# EasyEDA Pro project 水利智能船.epro, schematic Schematic1
Board Name: Board1; Create Date: 2025-05-19; Page Name: P1; Project Name: 水利智能船; Schematic Name: Schematic1; Update Date: 2025-05-28; Company: 嘉立创EDA; Page Size: A4; Version: V1.0
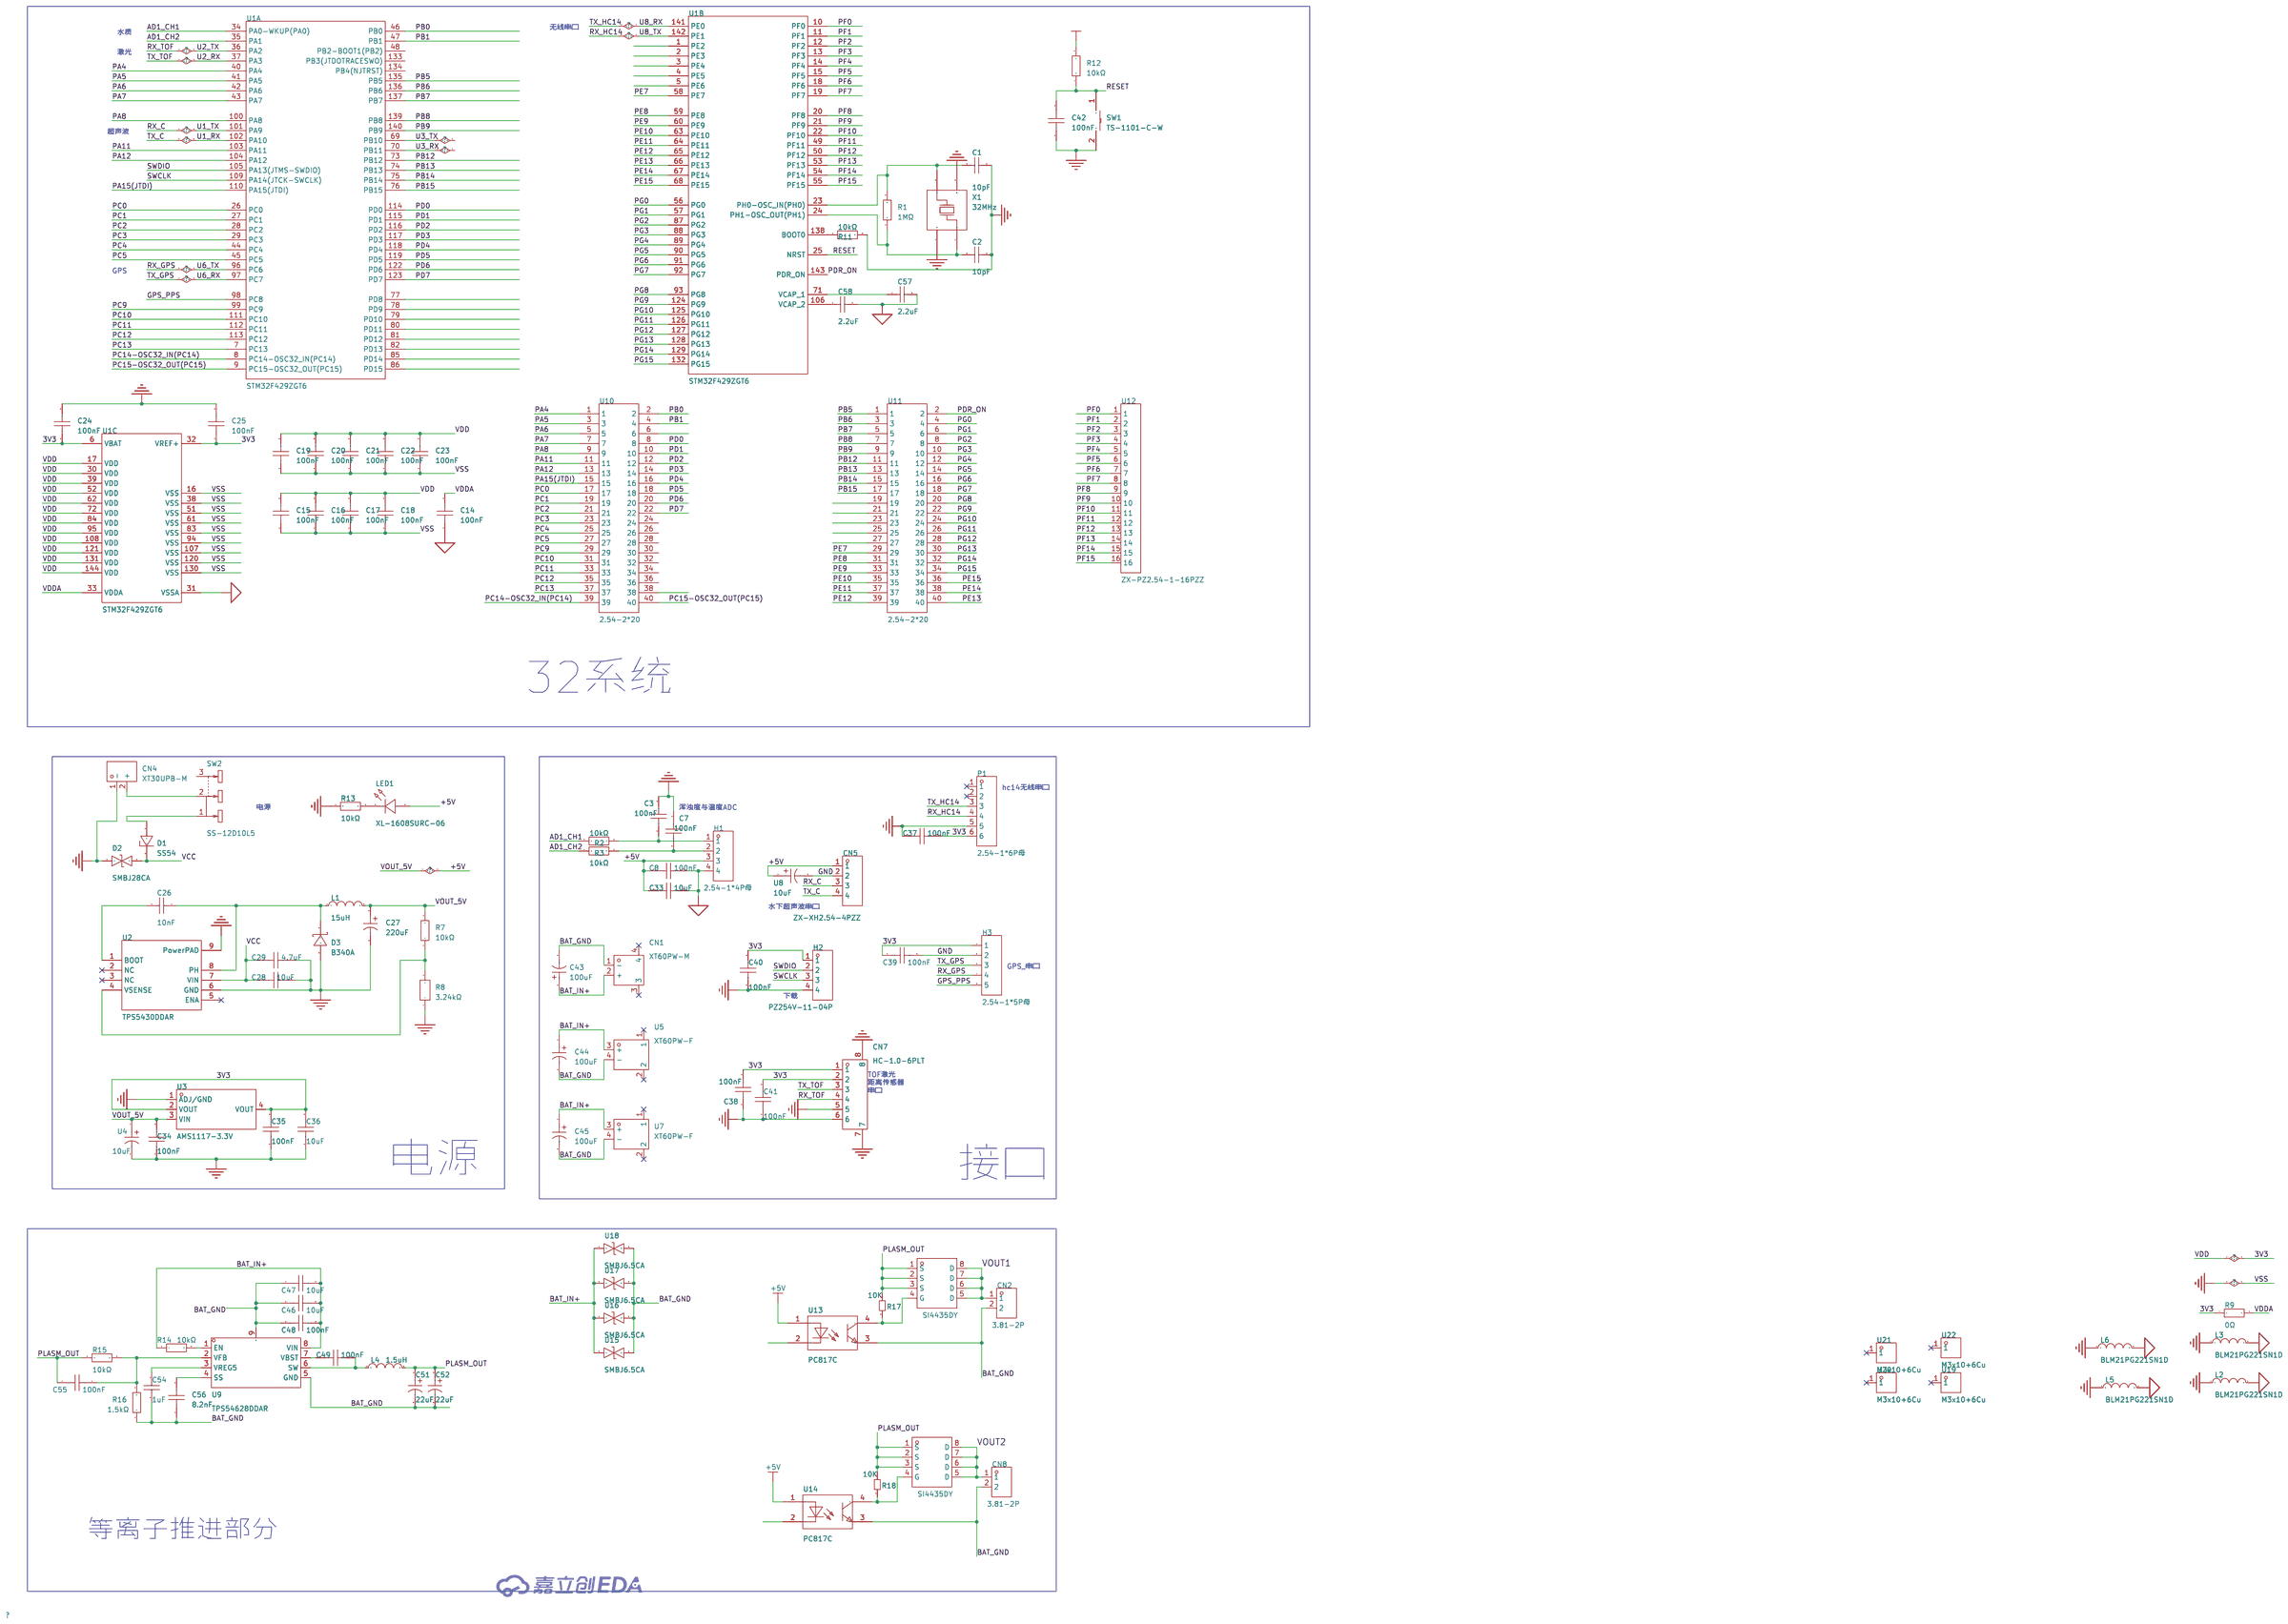
[diagram p0: schematic sheet]

## Parts
C1  10pF  [C0603]
C2  10pF  [C0603]
C3  100nF  [C0603]
C7  100nF  [C0603]
C8  100nF  [C0603]
C14  100nF  [C0603]
C15  100nF  [C0603]
C16  100nF  [C0603]
C17  100nF  [C0603]
C18  100nF  [C0603]
C19  100nF  [C0603]
C20  100nF  [C0603]
C21  100nF  [C0603]
C22  100nF  [C0603]
C23  100nF  [C0603]
C24  100nF  [C0603]
C25  100nF  [C0603]
C26  10nF  [C1206]
C27  220uF  [CAP-TH_BD6.3-P2.50-D0.6-FD-1]
C28  10uF  [C0805]
C29  4.7uF  [C0805]
C33  10uF  [C0603]
C34  100nF  [C0603]
C35  100nF  [C0603]
C36  10uF  [C0603]
C37  100nF  [C0603]
C38  100nF  [C0603]
C39  100nF  [C0603]
C40  100nF  [C0603]
C41  100nF  [C0603]
C42  100nF  [C0603]
C43  100uF  [CAP-TH_BD6.3-P2.50-D0.6-FD-1]
C44  100uF  [CAP-TH_BD6.3-P2.50-D0.6-FD-1]
C45  100uF  [CAP-TH_BD6.3-P2.50-D0.6-FD-1]
C46  10uF  [C1206]
C47  10uF  [C1206]
C48  100nF  [C0805]
C49  100nF  [C0805]
C51  22uF  [CAP-TH_BD6.3-P2.50-D0.6-FD-1]
C52  22uF  [CAP-TH_BD6.3-P2.50-D0.6-FD-1]
C54  1uF  [C0805]
C55  100nF  [C0805]
C56  8.2nF  [C0805]
C57  2.2uF  [C0603]
C58  2.2uF  [C0603]
CN1  XT60PW-M  [CONN-TH_XT60PW-M]
CN2  3.81-2P  [CONN-TH_2P-P3.81_KF2EDGR-3.81-2P]
CN4  XT30UPB-M  [CONN-TH_XT30UPB-M]
CN5  ZX-XH2.54-4PZZ  [CONN-TH_4P-P2.50_4PIN]
CN7  HC-1.0-6PLT  [CONN-SMD_6P-P1.00_HCTL_HC-1.0-6PLT]
CN8  3.81-2P  [CONN-TH_2P-P3.81_KF2EDGR-3.81-2P]
D1  SS54  [SMA_L4.3-W2.6-LS5.0-FD]
D2  SMBJ28CA  [SMB_L4.3-W3.6-LS5.4-BI]
D3  B340A  [SMA_L4.3-W2.6-LS5.1-RD]
H1  2.54-1*4P母  [HDR-TH_4P-P2.54-V-F]
H2  PZ254V-11-04P  [HDR-TH_4P-P2.54-V-M]
H3  2.54-1*5P母  [HDR-TH_5P-P2.54-V-F]
L1  15uH  [IND-SMD_L7.1-W6.6]
L2  BLM21PG221SN1D  [L0805]
L3  BLM21PG221SN1D  [L0805]
L4  1.5uH  [IND-SMD_L7.0-W6.6]
L5  BLM21PG221SN1D  [L0805]
L6  BLM21PG221SN1D  [L0805]
LED1  XL-1608SURC-06  [LED0603-RD_RED]
P1  2.54-1*6P母  [HDR-TH_6P-P2.54-V-F]
Q1  SI4435DY  [SOP-8_L5.0-W4.0-P1.27-LS6.0-BL]
Q2  SI4435DY  [SOP-8_L5.0-W4.0-P1.27-LS6.0-BL]
R1  1MΩ  [R0603]
R2  10kΩ  [R0603]
R3  10kΩ  [R0603]
R7  10kΩ  [R0805]
R8  3.24kΩ  [R0805]
R9  0Ω  [R0603]
R11  10kΩ  [R0603]
R12  10kΩ  [R0603]
R13  10kΩ  [R0603]
R14  10kΩ  [R0805]
R15  10kΩ  [R1206]
R16  1.5kΩ  [R1206]
R17  10K  [R0805]
R18  10K  [R0805]
SW1  TS-1101-C-W  [SW-SMD_L6.0-W3.3-LS8.0]
SW2  SS-12D10L5  [SW-TH_SS-12D10L5]
U1  STM32F429ZGT6  [LQFP-144_L20.0-W20.0-P0.50-LS22.0-BL]  (sections 1,2,3)
U2  TPS5430DDAR  [ESOP-8_L4.9-W3.9-P1.27-LS6.0-TL-EP]
U3  AMS1117-3.3V  [SOT-223-4_L6.5-W3.5-P2.30-LS7.0-TR]
U4  10uF  [CAP-SMD_L2.0-W1.3-FD]
U5  XT60PW-F  [TH_2P-XT60PW-F]
U7  XT60PW-F  [TH_2P-XT60PW-F]
U8  10uF  [CAP-SMD_L2.0-W1.3-FD]
U9  TPS54628DDAR  [ESOP-8_L4.9-W3.9-P1.27-LS6.0-BL-EP]
U10  2.54-2*20  [HDR-TH_40P-P2.54-V-F-R2-C20-S2.54]
U11  2.54-2*20  [HDR-TH_40P-P2.54-V-F-R2-C20-S2.54]
U12  ZX-PZ2.54-1-16PZZ  [HDR-TH_16P-P2.54-V-M-2]
U13  PC817C  [OPTO-SMD-4_L4.6-W6.5-P2.54-LS10.3-TL]
U14  PC817C  [OPTO-SMD-4_L4.6-W6.5-P2.54-LS10.3-TL]
U15  SMBJ6.5CA  [SMB_L4.6-W3.5-LS5.3-BI]
U16  SMBJ6.5CA  [SMB_L4.6-W3.5-LS5.3-BI]
U17  SMBJ6.5CA  [SMB_L4.6-W3.5-LS5.3-BI]
U18  SMBJ6.5CA  [SMB_L4.6-W3.5-LS5.3-BI]
U19  M3x10+6Cu  [SMD_L4.7-W4.7-D3.0]
U20  M3x10+6Cu  [SMD_L4.7-W4.7-D3.0]
U21  M3x10+6Cu  [SMD_L4.7-W4.7-D3.0]
U22  M3x10+6Cu  [SMD_L4.7-W4.7-D3.0]
X1  32MHz  [CRYSTAL-SMD_4P-L3.2-W2.5-BL]

## Library data of the parts
C1 C2 = CL10C100JB8NNNC: 容值:10pF;精度:±5%;额定电压:50V;材质(温度系数):C0G;; LCSC Part Name: 10pF ±5% 50V; Supplier Part: C1634; Manufacturer: SAMSUNG(三星); Supplier Footprint: 0603; JLCPCB Part Class: 基础库; Datasheet: https://atta.szlcsc.com/upload/public/pdf/source/20160218/1457707763339.pdf; Supplier: LCSC; Tolerance: ±5%; Voltage Rated: 50V; Temperature Coefficient: C0G
C3 C7 C8 C14-C25 C34 C35 C37-C42 = CGA0603X7R104K500JT: 容值:100nF;精度:±10%;额定电压:50V;温度系数:X7R;; LCSC Part Name: 100nF ±10% 50V; Supplier Part: C6119867; Manufacturer: HRE(芯声); Supplier Footprint: 0603; JLCPCB Part Class: 扩展库; Datasheet: https://atta.szlcsc.com/upload/public/pdf/source/20250103/C44077DA9E7B3EFAE02F22B6D3D1CBC9.pdf; Supplier: LCSC; Tolerance: ±10%; Voltage Rating: 50V; Temperature Coefficient: X7R
C26 = 1206B103K102NT: 容值:10nF;精度:±10%;额定电压:1kV;温度系数:X7R;; LCSC Part Name: 10nF ±10% 1kV; Supplier Part: C9194; Manufacturer: FH(风华); Supplier Footprint: 1206; JLCPCB Part Class: 扩展库; Datasheet: https://atta.szlcsc.com/upload/public/pdf/source/20200305/C486355_26A10D38EF8C2A5C37091D0039909270.pdf; Supplier: LCSC; Tolerance: ±10%; Voltage Rating: 1kV; Temperature Coefficient: X7R
C27 = PA35V220M6x12: 容值:220uF;精度:±20%;额定电压:35V;纹波电流:3.98A@100Hz;等效串联电阻(ESR):16mΩ@100kHz;类型:-;; LCSC Part Name: 220uF ±20% 35V; Supplier Part: C46550432; Manufacturer: 捷而瑞; Supplier Footprint: 插件,D6.3xL12mm; JLCPCB Part Class: 扩展库; Datasheet: https://atta.szlcsc.com/upload/public/pdf/source/20250307/831193F737CAF6D75AC25F14E955F0EC.pdf; Supplier: LCSC; Tolerance: ±20%; Voltage Rating: 35V; Ripple Current: 3.98A@100Hz; Equivalent Series Resistance(ESR): 16mΩ@100kHz; Diameter: 6.3mm; Height - Seated (Max): 12mm; Lifetime: 2000hrs@105℃; Operating Temperature: -55℃~+105℃
C28 = CGA0805X5R106K250MT: 容值:10uF;精度:±10%;额定电压:25V;温度系数:X5R;; LCSC Part Name: 10uF ±10% 25V; Supplier Part: C6119887; Manufacturer: HRE(芯声); Supplier Footprint: 0805; JLCPCB Part Class: 扩展库; Supplier: LCSC; Tolerance: ±10%; Voltage Rating: 25V; Temperature Coefficient: X5R
C29 = CGA0805X7R475K350MT: 容值:4.7uF;精度:±10%;额定电压:35V;材质(温度系数):X7R;; LCSC Part Name: 4.7uF ±10% 35V; Supplier Part: C6119943; Manufacturer: HRE(芯声); Supplier Footprint: 0805; JLCPCB Part Class: 扩展库; Supplier: LCSC; Tolerance: ±10%; Voltage Rated: 35V; Temperature Coefficient: X7R
C33 C36 = CGA0603X5R106K100JT: 容值:10uF;精度:±10%;额定电压:10V;温度系数:X5R;; LCSC Part Name: 10uF ±10% 10V; Supplier Part: C6119842; Manufacturer: HRE(芯声); Supplier Footprint: 0603; JLCPCB Part Class: 扩展库; Supplier: LCSC; Tolerance: ±10%; Voltage Rating: 10V; Temperature Coefficient: X5R
C43-C45 = PA50V100M6x12: 容值:100uF;精度:±20%;额定电压:50V;纹波电流:2.98A@100Hz;等效串联电阻(ESR):25mΩ@100kHz;类型:-;; LCSC Part Name: 100uF ±20% 50V; Supplier Part: C46550456; Manufacturer: 捷而瑞; Supplier Footprint: 插件,D6.3xL12mm; JLCPCB Part Class: 扩展库; Datasheet: https://atta.szlcsc.com/upload/public/pdf/source/20250307/831193F737CAF6D75AC25F14E955F0EC.pdf; Supplier: LCSC; Tolerance: ±20%; Voltage Rating: 50V; Ripple Current: 2.98A@100Hz; Equivalent Series Resistance(ESR): 25mΩ@100kHz; Diameter: 6.3mm; Height - Seated (Max): 12mm; Lifetime: 2000hrs@105℃; Operating Temperature: -55℃~+105℃
C46 C47 = HGC1206R5106K500NSPJ: 容值:10uF;精度:±10%;额定电压:50V;温度系数:X5R;; LCSC Part Name: 10uF ±10% 50V; Supplier Part: C7432781; Manufacturer: Chinocera(华瓷); Supplier Footprint: 1206; JLCPCB Part Class: 扩展库; Datasheet: https://atta.szlcsc.com/upload/public/pdf/source/20240320/FAC3FEC40A78BC5CCCE96C232A94D860.pdf; Supplier: LCSC; Tolerance: ±10%; Voltage Rating: 50V; Temperature Coefficient: X5R
C48 C49 C55 = CC0805KRX7R9BB104: 容值:100nF;精度:±10%;额定电压:50V;材质(温度系数):X7R;; LCSC Part Name: 100nF ±10% 50V; Supplier Part: C49678; Manufacturer: YAGEO(国巨); Supplier Footprint: 0805; JLCPCB Part Class: 基础库; Datasheet: https://atta.szlcsc.com/upload/public/pdf/source/20180224/C181747_15194369449651363981.pdf; Supplier: LCSC; Tolerance: ±10%; Voltage Rated: 50V; Temperature Coefficient: X7R
C51 C52 = PA50V22M6x7: 容值:22uF;精度:±20%;额定电压:50V;纹波电流:2.6A@100Hz;等效串联电阻(ESR):40mΩ@100kHz;类型:-;; LCSC Part Name: 22uF ±20% 50V; Supplier Part: C46550455; Manufacturer: 捷而瑞; Supplier Footprint: 插件,D6.3xL7mm; JLCPCB Part Class: 扩展库; Datasheet: https://atta.szlcsc.com/upload/public/pdf/source/20250307/831193F737CAF6D75AC25F14E955F0EC.pdf; Supplier: LCSC; Tolerance: ±20%; Voltage Rating: 50V; Ripple Current: 2.6A@100Hz; Equivalent Series Resistance(ESR): 40mΩ@100kHz; Diameter: 6.3mm; Height - Seated (Max): 7mm; Lifetime: 2000hrs@105℃; Operating Temperature: -55℃~+105℃
C54 = CL21B105KBFNNNE: 容值:1uF;精度:±10%;额定电压:50V;材质(温度系数):X7R;; LCSC Part Name: 1uF ±10% 50V; Supplier Part: C28323; Manufacturer: SAMSUNG(三星); Supplier Footprint: 0805; JLCPCB Part Class: 基础库; Datasheet: https://atta.szlcsc.com/upload/public/pdf/source/20160218/1457707763339.pdf; Supplier: LCSC; Tolerance: ±10%; Voltage Rated: 50V; Temperature Coefficient: X7R
C56 = HGC0805R7822K500NTHJ: 容值:8.2nF;精度:±10%;额定电压:50V;温度系数:X7R;; LCSC Part Name: 8.2nF ±10% 50V; Supplier Part: C5186817; Manufacturer: Chinocera(华瓷); Supplier Footprint: 0805; JLCPCB Part Class: 扩展库; Datasheet: https://atta.szlcsc.com/upload/public/pdf/source/20240320/FAC3FEC40A78BC5CCCE96C232A94D860.pdf; Supplier: LCSC; Tolerance: ±10%; Voltage Rating: 50V; Temperature Coefficient: X7R
C57 C58 = CL10A225KO8NNNC: 容值:2.2uF;精度:±10%;额定电压:16V;材质(温度系数):X5R;; LCSC Part Name: 2.2uF ±10% 16V; Supplier Part: C23630; Manufacturer: SAMSUNG(三星); Supplier Footprint: 0603; JLCPCB Part Class: 基础库; Datasheet: https://atta.szlcsc.com/upload/public/pdf/source/20160218/1457707763339.pdf; Supplier: LCSC; Tolerance: ±10%; Voltage Rated: 16V; Temperature Coefficient: X5R
CN1 = XT60PW-M: 类别:-;类型1:-;; LCSC Part Name: AMASS(艾迈斯)航模插头xt60连接器150公母对接pw锂电池公头 板插卧式XT60PW-M; Supplier Part: C98732; Manufacturer: AMASS(艾迈斯); JLCPCB Part Class: 扩展库; Datasheet: https://atta.szlcsc.com/upload/public/pdf/source/20240118/44A3DCFF53BE25DC65378AFFB21277A4.pdf; Supplier: LCSC; Brand: 艾迈斯; Type: 卧式插头; Colour: 黄色; InterfaceType: 公头
CN2 CN8 = KF2EDGR-3.81-2P: 连接器类型:板端/插座-闭口;结构:1x2P;间距:3.81mm;颜色:绿色;安装方式:弯针;排数:1;每排PIN数:2;额定电流:8A;额定电压:300V;工作温度范围:-40℃~+105℃;; LCSC Part Name: 3.81mm 1x2P 排数:1 每排P数:2; Supplier Part: C441182; Manufacturer: KEFA(科发); Supplier Footprint: 弯插,P=3.81mm; JLCPCB Part Class: 扩展库; Datasheet: https://atta.szlcsc.com/upload/public/pdf/source/20230331/6258E6C6BF04EFF922F3E5A9E72A4547.pdf; Supplier: LCSC; Connector Type: 板端/插座-闭口; Structure: 1x2P; Pitch: 3.81mm; Color: 绿色; Mounting Style: 弯针; Number of Pins: 2P; Number of Rows: 1; Number of PINs Per Row: 2; Current Rating (Max): 8A; Voltage Rating (Max): 300V; Operating Temperature Range: -40℃~+105℃
CN4 = XT30UPB-M: 类别:-;类型1:-;; LCSC Part Name: AMASS(艾迈斯)板载立式 航模锂电池控制器连接器插头 公头XT30UPB-M; Supplier Part: C428721; Manufacturer: AMASS(艾迈斯); JLCPCB Part Class: 扩展库; Datasheet: https://atta.szlcsc.com/upload/public/pdf/source/20230412/7B5DFEF57C9EA5273853390C734B3AC5.pdf; Supplier: LCSC; Brand: 艾迈斯; Type: 航模插头; Colour: 黄色; RatedVoltage: DC 500V; InterfaceType: 公头; MetalMaterial: 镀金; InsulationMaterial: PA; RatedCurrent: 15A; contact resistance: 0.65mΩ
CN5 = ZX-XH2.54-4PZZ: 插针结构:1x4P;间距:2.5mm;安装方式:直插;参考系列:XH;总PIN数:4P;排数:1;每排PIN数:4;行距:-;额定电流:3A;触头材质:黄铜;触头镀层:锡;工作温度范围:-25℃~+85℃;; LCSC Part Name: 1x4P 间距:2.5mm 直插 系列:XH; Supplier Part: C7429634; Manufacturer: Megastar(兆星); Supplier Footprint: 插件,P=2.5mm; JLCPCB Part Class: 扩展库; Datasheet: https://atta.szlcsc.com/upload/public/pdf/source/20230619/B529A2163E0159A644AB3383D208FB03.pdf; Supplier: LCSC; Pins Structure: 1x4P; Pitch: 2.5mm; Mounting Type: 直插; Reference Series: XH; Number of Pins: 4P; Number of Rows: 1; Number of PINs Per Row: 4; Rated Current: 3A; Contact Material: 黄铜; Contact Plating: 锡; Operating Temperature: -25℃~+85℃; Rated Voltage (Max): 250V; Plastic Material: PA66; Flame Retardant Rating: UL94V-0; Color: 白色; Z-Height of the Board: 7mm; X-Length of Bottom Edge on Board (Spacing Line): 12.5mm; Y-Width of Bottom Edge on Board: 5.9mm
CN7 = HC-1.0-6PLT: 插针结构:1x6P;间距:1mm;安装方式:立贴;参考系列:SH;总PIN数:6P;排数:1;每排PIN数:6;行距:-;额定电流:1A;触头材质:磷青铜;触头镀层:锡;工作温度范围:-25℃~+85℃;; LCSC Part Name: 1x6P 间距:1mm 立贴 系列:SH; Supplier Part: C2845374; Manufacturer: HCTL(华灿天禄); Supplier Footprint: SMD,P=1mm; JLCPCB Part Class: 扩展库; Datasheet: https://atta.szlcsc.com/upload/public/pdf/source/20230707/856B0E69F1F787EF574200B3D73A313F.pdf; Supplier: LCSC; Pins Structure: 1x6P; Pitch: 1mm; Mounting Style: 立贴; Reference Series: SH; Number of Pins: 6P; Number of Rows: 1; Number of PINs Per Row: 6; Current Rating (Max): 1A; Contact Material: 磷青铜; Contact Plating: 锡; Operating Temperature Range: -25℃~+85℃; Rated Voltage (Max): 50V; Plastic Material: LCP; Flame Retardant Rating: UL94V-0; Supplementary Features: 辅助焊脚; Z-Height of the Board: 4.4mm; X-Length of Bottom Edge on Board (Spacing Line): 8.3mm; Y-Width of Bottom Edge on Board: 3.76mm
D1 = SS54_C7420369: 二极管配置:独立式;正向压降(Vf):550mV@5.0A;直流反向耐压(Vr):40V;整流电流:5A;; LCSC Part Name: 电压:40V 电流:5A; Supplier Part: C7420369; Manufacturer: 宏迦橙; Supplier Footprint: SMA(DO-214AC); JLCPCB Part Class: 扩展库; Datasheet: https://atta.szlcsc.com/upload/public/pdf/source/20230828/254C3882F8647358AD9F60DD73611B5E.pdf; Supplier: LCSC; Diode Configuration: 独立式; Forward Voltage (Vf@If): 550mV@5.0A; Reverse Voltage (Vr): 40V; Rectified Current: 5A; Reverse Leakage Current (Ir): 50uA@40V
D2 = SMBJ28CA_C151259: 反向截止电压(Vrwm):28V;最大钳位电压:45.4V;峰值脉冲电流(Ipp)@10/1000us:13.3A;峰值脉冲功率(Ppp)@10/1000us:600W;击穿电压:31.1V;; Supplier Part: C151259; Manufacturer: Littelfuse(美国力特); Supplier Footprint: SMB(DO-214AA); JLCPCB Part Class: 扩展库; Datasheet: https://atta.szlcsc.com/upload/public/pdf/source/20190807/C409416_D98C874D944FBE9BE31A2BD6B7A21533.pdf; Supplier: LCSC; Reverse Stand-Off Voltage (Vrwm): 28V; Maximum Clamping Voltage: 45.4V; Peak Pulse Current (Ipp)@10/1000us: 13.3A; Peak Pulse Power Dissipation (Ppp)@10/1000us: 600W; Breakdown Voltage: 31.1V; Type: TVS
D3 = B340A: 二极管配置:独立式;正向压降(Vf):550mV@3A;直流反向耐压(Vr):40V;整流电流:3A;; LCSC Part Name: 电压:40V 电流:3A; Supplier Part: C64982; Manufacturer: MDD(辰达半导体); Supplier Footprint: SMA(DO-214AC); JLCPCB Part Class: 扩展库; Datasheet: https://atta.szlcsc.com/upload/public/pdf/source/20240710/591710C3B34CDB7FE3DA92C119E6F598.pdf; Supplier: LCSC; Diode Configuration: 独立式; Forward Voltage (Vf@If): 550mV@3A; Reverse Voltage (Vr): 40V; Rectified Current: 3A; Reverse Leakage Current (Ir): 500uA@40V
H1 = 2.54-1*4P母: 插孔结构:1x4P;间距:2.54mm;行距:-;圆孔/方孔:方孔;安装类型:直插;排数:单排;总孔位数:4P;额定电流:3A;额定电压:-;插孔方向:顶部;塑高:-;触头材质:青铜;触头镀层:-;工作温度范围:-40℃~+105℃;焊接温度(最大值):-;; LCSC Part Name: 间距:2.54mm 1x4P 直插; Supplier Part: C2718488; Manufacturer: BOOMELE(博穆精密); Supplier Footprint: 插件,P=2.54mm; JLCPCB Part Class: 扩展库; Datasheet: https://atta.szlcsc.com/upload/public/pdf/source/20210301/C2718488_F4427B881E42CAA8DDB0B1C12B3A522C.pdf; Supplier: LCSC; Holes Structure: 1x4P; Pitch: 2.54mm; Circular Hole / Square Hole: 方孔; Mounting Type: 直插; Number of Rows: 单排; Number of Holes: 4P; Current Rating (Max): 3A; Holes Direction: 顶部; Contact Material: 青铜; Operating Temperature Range: -40℃~+105℃
H2 = PZ254V-11-04P: 插针结构:1x4P;间距:2.54mm;行距:-;圆针/方针:方针;安装类型:直插;排数:单排;总PIN位数:4P;额定电流:3A;额定电压:250V;配合针长度:6mm;塑高:2.5mm;端接针长度:3mm;触头材质:-;工作温度范围:-40℃~+105℃;颜色:黑色;; LCSC Part Name: 间距:2.54mm 1x4P 直插 方针; Supplier Part: C2691448; Manufacturer: XFCN(兴飞); Supplier Footprint: 插件,P=2.54mm; JLCPCB Part Class: 扩展库; Datasheet: https://atta.szlcsc.com/upload/public/pdf/source/20200309/C492403_F9F19131791D08044AD4F84F8E751A34.pdf; Supplier: LCSC; Pin Structure: 1x4P; Pitch: 2.54mm; Circluar Pins/Square Pins: 方针; Mounting Type: 直插; Number of Rows: 单排; Number of Pins: 4P; Current Rating (Max): 3A; Voltage Rating (Max): 250V; Length of Mating Pin: 6mm; Insulation Height: 2.5mm; Length of End Connection Pin: 3mm; Operating Temperature Range: -40℃~+105℃; Color: 黑色
H3 = 2.54-1*5P母: 插孔结构:1x5P;间距:2.54mm;行距:-;安装类型:直插;排数:单排;总孔位数:5P;塑高:-;触头材质:-;触头镀层:-;; LCSC Part Name: 间距:2.54mm 1x5P 直插; Supplier Part: C50950; Manufacturer: BOOMELE(博穆精密); Supplier Footprint: 插件,P=2.54mm; JLCPCB Part Class: 扩展库; Datasheet: https://atta.szlcsc.com/upload/public/pdf/source/20210301/C2718488_F4427B881E42CAA8DDB0B1C12B3A522C.pdf; Supplier: LCSC; Holes Structure: 1x5P; Pitch: 2.54mm; Mounting Type: 直插; Number of Rows: 单排; Number of Holes: 5P
L1 = SMMS0650-150M: 电感值:15uH;精度:±20%;额定电流:3.1A;饱和电流(Isat):5A;类型:一体成型电感;; LCSC Part Name: 15uH ±20% 5A; Supplier Part: C149585; Manufacturer: SXN(顺翔诺); Supplier Footprint: SMD,6.6x7.1mm; JLCPCB Part Class: 扩展库; Datasheet: https://atta.szlcsc.com/upload/public/pdf/source/20210810/BBF24330FB2F5029F637830BA9C42C0D.pdf; Supplier: LCSC; Tolerance: ±20%; Rated Current: 3.1A; Saturation Current (Isat): 5A; DC Resistance (DCR): 85mΩ; Type: 一体成型电感
L2 L3 L5 L6 = BLM21PG221SN1D: 标称阻抗@测试频率:220Ω@100MHz;误差:±25%;直流电阻(RDC):45mΩ;; LCSC Part Name: 单路 0805磁珠 阻抗220Ω@100MHz; Supplier Part: C85840; Manufacturer: muRata(村田); Supplier Footprint: 0805; JLCPCB Part Class: 扩展库; Datasheet: https://atta.szlcsc.com/upload/public/pdf/source/20180326/C118443_3FAC30E9A4F0E6B81275543C61E0685E.pdf; Supplier: LCSC; Impedance @ Frequency: 220Ω@100MHz; Tolerance: ±25%; DC Resistance: 45mΩ; Current Rating: 2A; Circuits: 1
L4 = FXL0630-1R5-M: 电感值:1.5uH;精度:±20%;额定电流:12A;饱和电流(Isat):14A;类型:一体成型电感;; LCSC Part Name: 1.5uH ±20% 14A; Supplier Part: C167217; Manufacturer: cjiang(长江微电); Supplier Footprint: SMD,6.6x7mm; JLCPCB Part Class: 扩展库; Datasheet: https://atta.szlcsc.com/upload/public/pdf/source/20240426/3189EA8206330E2108542F9E34E540E7.pdf; Supplier: LCSC; Tolerance: ±20%; Rated Current: 12A; Saturation Current (Isat): 14A; DC Resistance (DCR): 12.1mΩ; Type: 一体成型电感
LED1 = XL-1608SURC-06: 灯头类型:-;发光颜色:红色;正向压降(Vf):2.3V;功率:50mW;正向电流:20mA;波长:620nm~630nm;二极管配置:-;透镜颜色:无色透明透镜;色温:-;发光强度:225mcd;发光角度:120°;载带方式:正贴;工作温度:-20℃~+85℃;; Supplier Part: C965799; Manufacturer: XINGLIGHT(成兴光); Supplier Footprint: 0603; JLCPCB Part Class: 扩展库; Datasheet: https://atta.szlcsc.com/upload/public/pdf/source/20250213/F9766CE804AF391355DCDD48DB3E0DAB.pdf; Supplier: LCSC; Illumination Color: 红色; Voltage - Forward(Vf): 2.3V; Power(Watts): 50mW; Forward Current: 20mA; Wavelength - Dominant: 620nm~630nm; Peak Wavelength: 625nm; Lens Color: 无色透明透镜; Luminous Intensity: 225mcd; Viewing Angle: 120°; Mounting Sytle: 正贴; Operating Temperature: -20℃~+85℃
P1 = 2.54-1*6P母: 插孔结构:1x6P;间距:2.54mm;行距:-;安装类型:直插;排数:单排;总孔位数:6P;塑高:-;触头材质:-;触头镀层:-;; LCSC Part Name: 间距:2.54mm 1x6P 直插; Supplier Part: C40877; Manufacturer: BOOMELE(博穆精密); Supplier Footprint: 插件,P=2.54mm; JLCPCB Part Class: 扩展库; Datasheet: https://atta.szlcsc.com/upload/public/pdf/source/20210301/C2718488_F4427B881E42CAA8DDB0B1C12B3A522C.pdf; Supplier: LCSC; Holes Structure: 1x6P; Pitch: 2.54mm; Mounting Type: 直插; Number of Rows: 单排; Number of Holes: 6P
Q1 Q2 = SI4435DY_C382326: 类型:P沟道;漏源电压(Vdss):30V;连续漏极电流(Id):8.8A;功率(Pd):2.5W;导通电阻(RDS(on)@Vgs,Id):20mΩ@10V,8A;阈值电压(Vgs(th)@Id):3V@250uA;; LCSC Part Name: P沟道 30V 8.8A; Supplier Part: C382326; Manufacturer: KEXIN(科信); Supplier Footprint: SOP-8; JLCPCB Part Class: Extended Part; Datasheet: https://atta.szlcsc.com/upload/public/pdf/source/20190705/C382326_F36EB2E223B1066BA249D2C6D7A5BA1D.pdf; Supplier: LCSC; Type: P沟道; Drain Source Voltage (Vdss): 30V; Continuous Drain Current (Id): 8.8A; Power Dissipation (Pd): 2.5W; Drain Source On Resistance (RDS(on)@Vgs,Id): 20mΩ@10V,8A; Gate Threshold Voltage (Vgs(th)@Id): 3V@250uA
R1 = 0603WAF1004T5E: 电阻类型:厚膜电阻;阻值:1MΩ;精度:±1%;功率:100mW;最大工作电压:75V;温度系数:±100ppm/℃;; LCSC Part Name: 1MΩ ±1% 100mW 厚膜电阻; Supplier Part: C22935; Manufacturer: UNI-ROYAL(厚声); Supplier Footprint: 0603; JLCPCB Part Class: 基础库; Datasheet: https://atta.szlcsc.com/upload/public/pdf/source/20200306/C422600_1E6D84923E4A46A82E41ADD87F860B5C.pdf; Supplier: LCSC; Type: 厚膜电阻; Tolerance: ±1%; Power(Watts): 100mW; Overload Voltage (Max): 75V; Temperature Coefficient: ±100ppm/℃; Operating Temperature Range: -55℃~+155℃
R2 R3 R11-R13 = 0603WAF1002T5E: 电阻类型:厚膜电阻;阻值:10kΩ;精度:±1%;功率:100mW;最大工作电压:75V;温度系数:±100ppm/℃;; LCSC Part Name: 厚膜电阻 10kΩ ±1% 100mW; Supplier Part: C25804; Manufacturer: UNI-ROYAL(厚声); Supplier Footprint: 0603; JLCPCB Part Class: 基础库; Datasheet: https://atta.szlcsc.com/upload/public/pdf/source/20200306/C422600_1E6D84923E4A46A82E41ADD87F860B5C.pdf; Supplier: LCSC; Type: 厚膜电阻; Tolerance: ±1%; Power(Watts): 100mW; Overload Voltage (Max): 75V; Temperature Coefficient: ±100ppm/℃; Operating Temperature Range: -55℃~+155℃
R7 R14 = 0805W8F1002T5E_C17414: 电阻类型:厚膜电阻;阻值:10kΩ;精度:±1%;功率:125mW;最大工作电压:150V;温度系数:±100ppm/℃;; LCSC Part Name: 10kΩ ±1% 125mW 厚膜电阻; Supplier Part: C17414; Manufacturer: UNI-ROYAL(厚声); Manufacturer Part: 0805W8F1002T5E; Supplier Footprint: 0805; JLCPCB Part Class: 基础库; Datasheet: https://atta.szlcsc.com/upload/public/pdf/source/20200306/C422600_1E6D84923E4A46A82E41ADD87F860B5C.pdf; Supplier: LCSC; Type: 厚膜电阻; Tolerance: ±1%; Power(Watts): 125mW; Overload Voltage (Max): 150V; Temperature Coefficient: ±100ppm/℃; Operating Temperature Range: -55℃~+155℃
R8 = FRC0805F3241TS: 电阻类型:厚膜电阻;阻值:3.24kΩ;精度:±1%;功率:125mW;最大工作电压:150V;温度系数:±100ppm/℃;; LCSC Part Name: 3.24kΩ ±1% 125mW 厚膜电阻; Supplier Part: C2933414; Manufacturer: FOJAN(富捷); Supplier Footprint: 0805; JLCPCB Part Class: 扩展库; Datasheet: https://atta.szlcsc.com/upload/public/pdf/source/20211221/925EC7D7225764EE0046F22065062C87.pdf; Supplier: LCSC; Type: 厚膜电阻; Tolerance: ±1%; Power(Watts): 125mW; Overload Voltage (Max): 150V; Temperature Coefficient: ±100ppm/℃; Operating Temperature Range: -55℃~+155℃
R9 = 0603WAF0000T5E: 电阻类型:厚膜电阻;阻值:0Ω;精度:±1%;功率:100mW;最大工作电压:75V;; LCSC Part Name: 0Ω ±1% 100mW 厚膜电阻; Supplier Part: C21189; Manufacturer: UNI-ROYAL(厚声); Supplier Footprint: 0603; JLCPCB Part Class: 基础库; Datasheet: https://atta.szlcsc.com/upload/public/pdf/source/20200306/C422600_1E6D84923E4A46A82E41ADD87F860B5C.pdf; Supplier: LCSC; Type: 厚膜电阻; Tolerance: ±1%; Power(Watts): 100mW; Overload Voltage (Max): 75V; Operating Temperature Range: -55℃~+155℃
R15 = 1206W4F1002T5E: 电阻类型:厚膜电阻;阻值:10kΩ;精度:±1%;功率:250mW;最大工作电压:200V;温度系数:±100ppm/℃;; LCSC Part Name: 10kΩ ±1% 250mW 厚膜电阻; Supplier Part: C17902; Manufacturer: UNI-ROYAL(厚声); Supplier Footprint: 1206; JLCPCB Part Class: 基础库; Datasheet: https://atta.szlcsc.com/upload/public/pdf/source/20200306/C422600_1E6D84923E4A46A82E41ADD87F860B5C.pdf; Supplier: LCSC; Type: 厚膜电阻; Tolerance: ±1%; Power(Watts): 250mW; Overload Voltage (Max): 200V; Temperature Coefficient: ±100ppm/℃; Operating Temperature Range: -55℃~+155℃
R16 = 1206W4F1501T5E: 电阻类型:厚膜电阻;阻值:1.5kΩ;精度:±1%;功率:250mW;最大工作电压:200V;温度系数:±100ppm/℃;; LCSC Part Name: 1.5kΩ ±1% 250mW 厚膜电阻; Supplier Part: C26030; Manufacturer: UNI-ROYAL(厚声); Supplier Footprint: 1206; JLCPCB Part Class: 扩展库; Datasheet: https://atta.szlcsc.com/upload/public/pdf/source/20200306/C422600_1E6D84923E4A46A82E41ADD87F860B5C.pdf; Supplier: LCSC; Type: 厚膜电阻; Tolerance: ±1%; Power(Watts): 250mW; Overload Voltage (Max): 200V; Temperature Coefficient: ±100ppm/℃; Operating Temperature Range: -55℃~+155℃
R17 R18 = 10K: Design Item ID: 电阻; Library Name: 新 Sch
SW1 = TS-1101-C-W: 电路结构:单刀单掷;按钮形状:矩形按钮;作用力:260gf;安装方式:立贴;开关长度:6mm;开关宽度:3.6mm;开关高度:2.5mm;带支架:不带;触点电流:50mA;额定电压(AC):-;额定电压(DC):12V;额定功率:-;绝缘电阻:-;带灯:无;机械寿命:5万次;; LCSC Part Name: 6*3.6*2.5mm 立贴 轻触开关; Supplier Part: C318938; Manufacturer: XKB Connectivity(中国星坤); Supplier Footprint: SMD; JLCPCB Part Class: 扩展库; Datasheet: https://atta.szlcsc.com/upload/public/pdf/source/20200227/C318938_C2E53B1EEDE37D980A33616AC086DE53.pdf; Supplier: LCSC; Circuit: 单刀单掷; Actuator Style: 矩形按钮; Operating Force: 260gf; Mounting Style: 立贴; Switch Length: 6mm; Switch Width: 3.6mm; Switch Height: 2.5mm; Strike Gundam: 不带; Contact Current: 50mA; Voltage Rating (DC): 12V; Actuator/Cap Color: 白色带淡绿; With Lamp: 无; Mechanical Life: 5万次; Operating Temperature: -30℃~+85℃
SW2 = SS-12D10L5: 电路结构:单刀双掷;安装方式:直插;开关颜色:黑色;额定电流(DC):3A;额定电压(DC):125V;额定电流(AC):3A;额定电压(AC):125V;机械寿命:1万次;; LCSC Part Name: 柄长5mm 直插双档 滑动开关; Supplier Part: C319012; Manufacturer: XKB Connectivity(中国星坤); Supplier Footprint: 插件; JLCPCB Part Class: 扩展库; Datasheet: https://atta.szlcsc.com/upload/public/pdf/source/20211009/D6412F37AABE6F9459A6EE7FA4DAEADB.pdf; Supplier: LCSC; Circuit: 单刀双掷; Actuator Style: 矩形柱状; Pin Style: PC引脚; Switch Length: 13mm; Switch Width: 6.8mm; Switch Height: 6.4mm; Mounting Style: 直插; Actuator Color: 黑色; Current Rating (DC): 3A; Voltage Rating (DC): 125V; Current Rating (AC): 3A; Voltage Rating (AC): 125V; Mechanical Life: 1万次; Operating Temperature: -40℃~+85℃
U1 = STM32F429ZGT6: CPU内核:ARM-M4;CPU最大主频:180MHz;应用领域:-;; LCSC Part Name: 带DSP和FPU的高性能高级系列ARM Cortex-M4 MCU，具有1 MB Flash、180 MHz CPU、ART加速器、Chrom-ART加速器、TFT、带SDRAM的FMC和TFT; Supplier Part: C46525; Manufacturer: ST(意法半导体); Supplier Footprint: LQFP-144(20x20); JLCPCB Part Class: 扩展库; Datasheet: https://atta.szlcsc.com/upload/public/pdf/source/20170102/1483323670635.pdf; Supplier: LCSC; CPU Core: ARM-M4; CPU Maximum Speed: 180MHz; Program Storage Size: 1MB; Number of I/O: 114; ADC (Bit): 12bit; DAC (Bit): 12bit; Voltage - Supply: 1.8V~3.6V
U2 = TPS5430DDAR: 功能类型:降压型;输出类型:可调;工作电压:5.5V~36V;输出电压:1.221V~32.04V;输出电流:3A;; LCSC Part Name: 宽输入范围、3A输出电流的降压转换器; Supplier Part: C9864; Manufacturer: TI(德州仪器); Supplier Footprint: SOIC-8-EP; JLCPCB Part Class: 基础库; Datasheet: https://www.ti.com/cn/lit/gpn/tps5430; Supplier: LCSC; Function: 降压型; Output Type: 可调; Input Voltage: 5.5V~36V; Output Voltage: 1.221V~32.04V; Output Current: 3A; Switching Frequency: 500kHz; Operating Temperature: -40℃~+125℃@(TJ); Synchronous Rectification: 否; Number of Outputs: 1; Topology: 降压式; Switch tube (built-in/external): 内置
U3 = AMS1117-3.3V: 输出类型:固定;最大输入电压:18V;输出电压:3.3V;最大输出电流:1A;输出极性:正极;; LCSC Part Name: 输入18V 输出3.3V 1A; Supplier Part: C5120765; Manufacturer: MSKSEMI(美森科); Supplier Footprint: SOT-223; JLCPCB Part Class: 扩展库; Datasheet: https://atta.szlcsc.com/upload/public/pdf/source/20230802/7000FCAFF33971783A269E7BD69EFE08.pdf; Supplier: LCSC; Output Type: 固定; Maximum Input Voltage: 18V; Output Voltage: 3.3V; MAX Output Current: 1A; Dropout Voltage: 1.4V@(1A); standby current: 12mA; Operating Temperature: 0℃~+125℃; Output Polarity: 正极; Number of Outputs: 1
U4 U8 = TMCP1A106MTRF: 容值:10uF;精度:±20%;额定电压:10V;等效串联电阻:5.9Ω@100kHz;; LCSC Part Name: 10uF ±20% 10V; Supplier Part: C1969735; Manufacturer: VISHAY(威世); Supplier Footprint: 0805; JLCPCB Part Class: 扩展库; Datasheet: https://atta.szlcsc.com/upload/public/pdf/source/20210506/EB7F77920409F8D63FFE94178A7159DC.pdf; Supplier: LCSC; Tolerance: ±20%; Rated Voltage: 10V; Equivalent Series Resistance(ESR): 5.9Ω@100kHz; Operating Temperature: -55℃~+125℃
U5 U7 = XT60PW-F: 类别:-;类型1:-;; LCSC Part Name: AMASS(艾迈斯)插头连接器锂电池组充电接口 航模电调卧式焊板 母头 XT60PW-F; Supplier Part: C428722; Manufacturer: AMASS(艾迈斯); JLCPCB Part Class: 扩展库; Datasheet: https://atta.szlcsc.com/upload/public/pdf/source/20190916/C428722_DFF78979486FCB0B58C1FC563067EC88.pdf; Supplier: LCSC; Type: 卧式插头; Colour: 黄色; InterfaceType: 母头
U9 = TPS54628DDAR: 功能类型:降压型;输出类型:可调;工作电压:4.5V~18V;输出电压:760mV~5.5V;输出电流:6A;; LCSC Part Name: 4.5V至18V输入,6A同步降压转换器; Supplier Part: C353861; Manufacturer: TI(德州仪器); Supplier Footprint: SOIC-8-EP; JLCPCB Part Class: 扩展库; Datasheet: https://www.ti.com/cn/lit/gpn/tps54628; Supplier: LCSC; Function: 降压型; Output Type: 可调; Input Voltage: 4.5V~18V; Output Voltage: 760mV~5.5V; Output Current: 6A; Switching Frequency: 650kHz; Operating Temperature: -40℃~+85℃; Synchronous Rectification: 是; Number of Outputs: 1; Topology: 降压式; Quiescent Current (Iq): 10uA; Switch tube (built-in/external): 内置
U10 U11 = 2.54-2*20: 插孔结构:2x20P;间距:2.54mm;行距:2.54mm;圆孔/方孔:方孔;安装类型:直插;排数:双排;总孔位数:40P;额定电流:2.5A;额定电压:-;插孔方向:顶部;塑高:8.5mm;工作温度范围:-40℃~+105℃;; LCSC Part Name: 间距:2.54mm 2x20P 直插; Supplier Part: C2977589; Manufacturer: ZHOURI(洲日); Supplier Footprint: 插件,P=2.54mm; JLCPCB Part Class: 扩展库; Datasheet: https://atta.szlcsc.com/upload/public/pdf/source/20220328/834E302BE3C038BBC5C70F5E02589B1E.pdf; Supplier: LCSC; Holes Structure: 2x20P; Pitch: 2.54mm; Row Spacing: 2.54mm; Circular Hole / Square Hole: 方孔; Mounting Type: 直插; Number of Rows: 双排; Number of Holes: 40P; Current Rating (Max): 2.5A; Holes Direction: 顶部; Insulation Height: 8.5mm; Operating Temperature Range: -40℃~+105℃
U12 = ZX-PZ2.54-1-16PZZ: 插针结构:1x16P;间距:2.54mm;行距:-;圆针/方针:方针;安装方式:直插;排数:单排;总PIN位数:16P;额定电流:3A;额定电压:1kV;配合针长度:6mm;塑高:2.5mm;端接针长度:3mm;触头材质:黄铜;触头镀层:金;工作温度:-40℃~+105℃;颜色:黑色;; LCSC Part Name: 1x16P 间距:2.54mm 方针 直插; Supplier Part: C7501270; Manufacturer: Megastar(兆星); Supplier Footprint: 插件,P=2.54mm; JLCPCB Part Class: 扩展库; Datasheet: https://atta.szlcsc.com/upload/public/pdf/source/20231122/E454B24BEC0C004E7BA34E686CD1994E.pdf; Supplier: LCSC; Pin Structure: 1x16P; Pitch: 2.54mm; Circluar Pins/Square Pins: 方针; Mounting Type: 直插; Number of Rows: 单排; Number of Pins: 16P; Current Rating: 3A; Voltage Rating (Max): 1kV; Length of Mating Pin: 6mm; Insulation Height: 2.5mm; Length of End Connection Pin: 3mm; Contact Material: 黄铜; Contact Plating: 金; Operating Temperature: -40℃~+105℃; Color: 黑色
U13 U14 = PC817C_C3025164: 输入电压类型:DC;正向电压:1.2V;输出电流:50mA;隔离电压(rms):5kV;反向电压:6V;负载电压:-;输出通道数:1;集射极饱和电压(Vce(sat)@Ic,IF):100mV@1mA,20mA;; LCSC Part Name: C档; Supplier Part: C3025164; Manufacturer: GOODWORK(固得沃克); Supplier Footprint: SMD-4P; JLCPCB Part Class: 扩展库; Datasheet: https://atta.szlcsc.com/upload/public/pdf/source/20220530/3FD5D572B823BA05C967330A07ECF74F.pdf; Supplier: LCSC; Input voltage type: DC; Output Type: 光电三极管; Forward Voltage: 1.2V; Output Current: 50mA; Isolation Voltage(rms): 5kV; Reverse Voltage: 6V; Number of Outputs: 1; Collector-Emitter Saturation Voltage (Vce(sat)@Ic,IF): 100mV@1mA,20mA; Rise time: 6us@2mA,100Ω; Fall time: 5us@2mA,100Ω; Operating Temperature: -55℃~+110℃
U15-U18 = SMBJ6.5CA_C7420377: 极性:双向;反向截止电压(Vrwm):6.5V;钳位电压:11.2V;峰值脉冲电流(Ipp):53.57A;峰值脉冲功率(Ppp):600W;击穿电压:7.22V;; Supplier Part: C7420377; Manufacturer: 宏嘉诚; Supplier Footprint: SMB; JLCPCB Part Class: 基础库; Datasheet: https://atta.szlcsc.com/upload/public/pdf/source/20250107/474F05451FC8AB27D7FA0238914F96F6.pdf; Supplier: LCSC; Polarity: 双向; Reverse Stand-Off Voltage (Vrwm): 6.5V; Clamping Voltage: 11.2V; Peak Pulse Current (Ipp): 53.57A; Peak Pulse Power Dissipation (Ppp): 600W; Voltage - Breakdown: 7.22V; Reverse Leakage Current (Ir): 500uA; Number of Channels: 单路; Type: TVS
U19-U22 = M3x10+6Cu: M3x10+6; LCSC Part Name: Shuntian(顺天五金) 单头六角隔离铜柱螺柱 M3X10+6 国标 黄铜 袋装; Supplier Part: C551322; Manufacturer: Shuntian(顺天五金); JLCPCB Part Class: 扩展库; Datasheet: https://atta.szlcsc.com/upload/public/pdf/source/20200518/C357406_C09EF4431115B36F205D341EAA7D5F43.pdf; Supplier: LCSC; length: 10mm; diameter: 3mm; Thread length: 6mm; material quality: 黄铜; standard: 国标; surface treatment: 本色; Specifications: M3X10+6; structure type: 单头; Shape Type: 六角; purpose: 隔离; type: 螺柱; hexagonal opposite edge: 4.7mm
X1 = X322532MMB4SI: 晶振类型:贴片晶振;频率:32MHz;常温频差:±10ppm;负载电容:10pF;频率稳定度(全温):±20ppm;; LCSC Part Name: 32MHz ±10ppm 10pF; Supplier Part: C113671; Manufacturer: YXC(扬兴晶振); Supplier Footprint: SMD3225-4P; JLCPCB Part Class: 扩展库; Datasheet: https://atta.szlcsc.com/upload/public/pdf/source/20240329/19D5F850207469550BEB00D7DFEDBC7A.pdf; Supplier: LCSC; Crystal Type: 贴片晶振; Normal temperature Frequency Tolerance: ±10ppm; Load Capacitor: 10pF; Frequency Stability(Full temperature range): ±20ppm; Operating Temperature: -40℃~+85℃

## Nets
3V3: C15.2 C16.2 C17.2 C18.2 C19.2 C20.2 C21.2 C22.2 C23.2 C24.1 C25.1 C35.2 C36.2 C37.2 C38.2 C39.1 C40.2 C41.2 CN7.1 CN7.2 H2.1 H3.1 P1.6 R9.1 R12.2 U1.6(VBAT) U1.17(VDD) U1.30(VDD) U1.32(VREF+) U1.39(VDD) U1.52(VDD) U1.62(VDD) U1.72(VDD) U1.84(VDD) U1.95(VDD) U1.108(VDD) U1.121(VDD) U1.131(VDD) U1.144(VDD) U3.2(VOUT) U3.4(VOUT)
+5V: C8.1 C27.1 C33.1 C34.2 CN5.1 H1.3 L1.2 LED1.2(A) R7.2 U3.3(VIN) U4.1 U8.1 U13.1 U14.1
AGND: C8.2 C14.1 C33.2 C57.2 C58.2 H1.4 L2.2 L3.2 L5.2 L6.2 U1.31(VSSA)
GND: C1.2 C2.2 C3.2 C7.1 C15.1 C16.1 C17.1 C18.1 C19.1 C20.1 C21.1 C22.1 C23.1 C24.2 C25.2 C27.2 C28.2 C29.2 C34.1 C35.1 C36.1 C37.1 C38.1 C39.2 C40.1 C41.1 C42.1 CN4.1(-) CN5.2 CN7.5 CN7.6 CN7.7 CN7.8 D2.1(K) D3.2(A) H2.4 H3.2 L2.1 L3.1 L5.1 L6.1 P1.5 R8.1 R11.2 R13.1 SW1.2 U1.16(VSS) U1.38(VSS) U1.51(VSS) U1.61(VSS) U1.83(VSS) U1.94(VSS) U1.107(VSS) U1.120(VSS) U1.130(VSS) U2.6(GND) U2.9(PowerPAD) U3.1(ADJ/GND) U4.2 U8.2 X1.2(GND) X1.4(GND)
VCC: C28.1 C29.1 D1.2(K) D2.2(A) U2.7(VIN)
VDDA: C14.2 R9.2 U1.33(VDDA)
AD1_CH1: R2.1 U1.34(PA0-WKUP(PA0))
AD1_CH2: R3.1 U1.35(PA1)
BAT_GND: C43.2 C44.2 C45.2 C46.1 C47.1 C48.1 C51.2 C52.2 C54.1 C56.1 CN1.1(-) CN2.2 CN8.2 R16.1 U5.4(-) U7.4(-) U9.5(GND) U9.9(PAD) U13.3 U14.3 U15.2 U16.2 U17.2 U18.2
BAT_IN+: C43.1 C44.1 C45.1 C46.2 C47.2 C48.2 CN1.2(+) R14.1 U5.3(+) U7.3(+) U9.8(VIN) U15.1 U16.1 U17.1 U18.1
GPS_PPS: H3.5 U1.98(PC8)
PA4: U1.40(PA4) U10.1
PA5: U1.41(PA5) U10.3
PA6: U1.42(PA6) U10.5
PA7: U1.43(PA7) U10.7
PA8: U1.100(PA8) U10.9
PA11: U1.103(PA11) U10.11
PA12: U1.104(PA12) U10.13
PA15(JTDI): U1.110(PA15(JTDI)) U10.15
PB0: U1.46(PB0) U10.2
PB1: U1.47(PB1) U10.4
PB5: U1.135(PB5) U11.1
PB6: U1.136(PB6) U11.3
PB7: U1.137(PB7) U11.5
PB8: U1.139(PB8) U11.7
PB9: U1.140(PB9) U11.9
PB12: U1.73(PB12) U11.11
PB13: U1.74(PB13) U11.13
PB14: U1.75(PB14) U11.15
PB15: U1.76(PB15) U11.17
PC0: U1.26(PC0) U10.17
PC1: U1.27(PC1) U10.19
PC2: U1.28(PC2) U10.21
PC3: U1.29(PC3) U10.23
PC4: U1.44(PC4) U10.25
PC5: U1.45(PC5) U10.27
PC9: U1.99(PC9) U10.29
PC10: U1.111(PC10) U10.31
PC11: U1.112(PC11) U10.33
PC12: U1.113(PC12) U10.35
PC13: U1.7(PC13) U10.37
PC14-OSC32_IN(PC14): U1.8(PC14-OSC32_IN(PC14)) U10.39
PC15-OSC32_OUT(PC15): U1.9(PC15-OSC32_OUT(PC15)) U10.40
PD0: U1.114(PD0) U10.8
PD1: U1.115(PD1) U10.10
PD2: U1.116(PD2) U10.12
PD3: U1.117(PD3) U10.14
PD4: U1.118(PD4) U10.16
PD5: U1.119(PD5) U10.18
PD6: U1.122(PD6) U10.20
PD7: U1.123(PD7) U10.22
PDR_ON: U1.143(PDR_ON) U11.2
PE7: U1.58(PE7) U11.29
PE8: U1.59(PE8) U11.31
PE9: U1.60(PE9) U11.33
PE10: U1.63(PE10) U11.35
PE11: U1.64(PE11) U11.37
PE12: U1.65(PE12) U11.39
PE13: U1.66(PE13) U11.40
PE14: U1.67(PE14) U11.38
PE15: U1.68(PE15) U11.36
PF0: U1.10(PF0) U12.1
PF1: U1.11(PF1) U12.2
PF2: U1.12(PF2) U12.3
PF3: U1.13(PF3) U12.4
PF4: U1.14(PF4) U12.5
PF5: U1.15(PF5) U12.6
PF6: U1.18(PF6) U12.7
PF7: U1.19(PF7) U12.8
PF8: U1.20(PF8) U12.9
PF9: U1.21(PF9) U12.10
PF10: U1.22(PF10) U12.11
PF11: U1.49(PF11) U12.12
PF12: U1.50(PF12) U12.13
PF13: U1.53(PF13) U12.14
PF14: U1.54(PF14) U12.15
PF15: U1.55(PF15) U12.16
PG0: U1.56(PG0) U11.4
PG1: U1.57(PG1) U11.6
PG2: U1.87(PG2) U11.8
PG3: U1.88(PG3) U11.10
PG4: U1.89(PG4) U11.12
PG5: U1.90(PG5) U11.14
PG6: U1.91(PG6) U11.16
PG7: U1.92(PG7) U11.18
PG8: U1.93(PG8) U11.20
PG9: U1.124(PG9) U11.22
PG10: U1.125(PG10) U11.24
PG11: U1.126(PG11) U11.26
PG12: U1.127(PG12) U11.28
PG13: U1.128(PG13) U11.30
PG14: U1.129(PG14) U11.32
PG15: U1.132(PG15) U11.34
PLASM_OUT: C51.1 C52.1 C55.1 L4.2 Q1.1(S) Q1.2(S) Q1.3(S) Q2.1(S) Q2.2(S) Q2.3(S) R15.1 R17.2 R18.2
RESET: C42.2 R12.1 SW1.1 U1.25(NRST)
RX_C: CN5.3 U1.101(PA9)
RX_GPS: H3.4 U1.96(PC6)
RX_HC14: P1.4 U1.142(PE1)
RX_TOF: CN7.4 U1.36(PA2)
SWCLK: H2.3 U1.109(PA14(JTCK-SWCLK))
SWDIO: H2.2 U1.105(PA13(JTMS-SWDIO))
TX_C: CN5.4 U1.102(PA10)
TX_GPS: H3.3 U1.97(PC7)
TX_HC14: P1.3 U1.141(PE0)
TX_TOF: CN7.3 U1.37(PA3)
U3_RX: U1.70(PB11)
U3_TX: U1.69(PB10)
VOUT1: CN2.1 Q1.5(D) Q1.6(D) Q1.7(D) Q1.8(D)
VOUT2: CN8.1 Q2.5(D) Q2.6(D) Q2.7(D) Q2.8(D)
$1N1342: C1.1 R1.2 U1.23(PH0-OSC_IN(PH0)) X1.3(OSC2)
$1N1938: C7.2 H1.2 R3.2
$1N3661: C3.1 H1.1 R2.2
$1N5258: C26.1 U2.1(BOOT)
$1N5263: C26.2 D3.1(K) L1.1 U2.8(PH)
$1N6361: R7.1 R8.2 U2.4(VSENSE)
$1N11253: R11.1 U1.138(BOOT0)
$1N11810: C2.1 R1.1 U1.24(PH1-OSC_OUT(PH1)) X1.1(OSC1)
$1N11862: LED1.1(K) R13.2
$1N14606: R14.2 U9.1(EN)
$1N14805: C49.2 L4.1 U9.6(SW)
$1N14818: C49.1 U9.7(VBST)
$1N15032: C56.2 U9.4(SS)
$1N15135: C54.2 U9.3(VREG5)
$1N15320: C55.2 R15.2 R16.2 U9.2(VFB)
$1N18281: CN4.2(+) SW2.2
$1N18286: D1.1(A) SW2.1
$1N24306: C57.1 U1.71(VCAP_1)
$1N24342: C58.1 U1.106(VCAP_2)
$1N25576: Q1.4(G) R17.1 U13.4
$1N25775: Q2.4(G) R18.1 U14.4

Not connected (* = marked no-connect by the designer): CN1 3* 4*; P1 1* 2*; SW2 3; U1 1(PE2) 2(PE3) 3(PE4) 4(PE5) 5(PE6) 48(PB2-BOOT1(PB2)) 77(PD8) 78(PD9) 79(PD10) 80(PD11) 81(PD12) 82(PD13) 85(PD14) 86(PD15) 133(PB3(JTDOTRACESWO)) 134(PB4(NJTRST)); U2 2(NC)* 3(NC)* 5(ENA)*; U5 1* 2*; U7 1* 2*; U10 6 24 26 28 30 32 34 36 38; U11 19 21 23 25 27; U13 2; U14 2; U19 1*; U20 1*; U21 1*; U22 1*

## Notes on the sheet
- 无线串口
- 水质
- 激光
- 超声波
- GPS
- 32系统
- hc14无线串口
- 电源
- 浑浊度与温度ADC
- 水下超声波串口
- GPS_串口
- 下载
- TOF激光
  距离传感器
  串口
- 电源
- 接口
- 等离子推进部分
